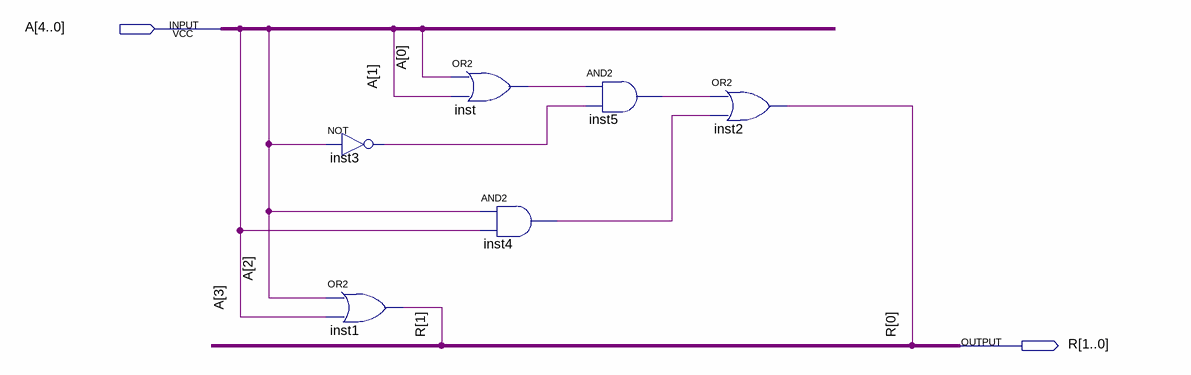
[diagram p0: schematic sheet]
// Quartus schematic RaizQua.bdf as structural Verilog: 6 symbols, 2 pins
module RaizQua (
  input  [4:0] A,
  output [1:0] R
);

  wire inst3_out, inst4_out, inst5_out, inst_out;

  not inst3 (inst3_out, A[2]);
  or inst1 (R[1], A[2], A[3]);
  or inst (inst_out, A[0], A[1]);
  and inst4 (inst4_out, A[2], A[3]);
  and inst5 (inst5_out, inst_out, inst3_out);
  or inst2 (R[0], inst5_out, inst4_out);
endmodule
